# Altium project StarWars.PrjPcb
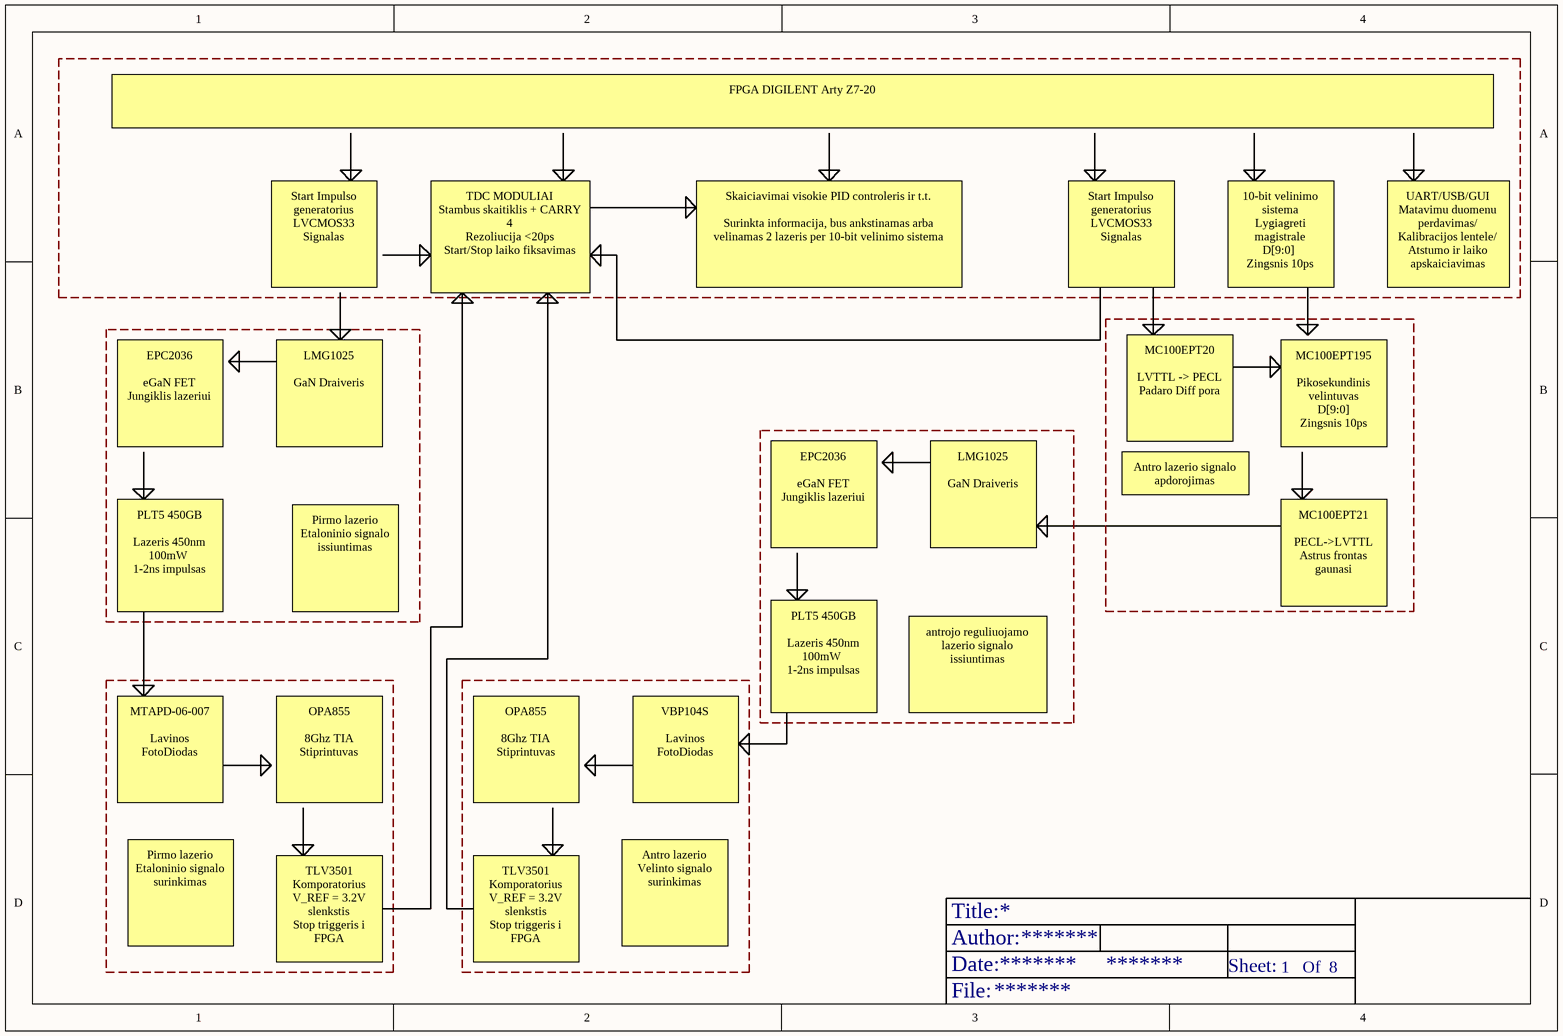
[diagram p0: Blokine diagrama.SchDoc]
8 sheets, 146 parts. Net scope: flat (ports and power ports of the same name join across sheets).
Board file: Prototype_REV1.PcbDoc
Sheets:
  Blokine diagrama.SchDoc
  Inputs_Outputs.SchDoc
  Rx_PSU.SchDoc
  Tx_PSU.SchDoc
  Time_Delay.SchDoc
  Laser_Driver.SchDoc
  Light_Detection.SchDoc
  Laser_System.SchDoc

## Sheet Blokine diagrama.SchDoc
size A4; Date: *******; ApprovedBy: *******; CheckedBy: None; Author: *******; CompanyName: *******; DrawnBy: Name; Engineer: *******; Organization: *******; Address1: *******; Address2: *******; Address3: *******; Address4: *******; DocumentNumber: Doc Num; Revision: *******; SheetNumber: 1; SheetTotal: 8; CurrentTime: *******; CurrentDate: *******; Time: *******; DocumentFullPathAndName: *******; DocumentName: *******; ModifiedDate: *******; ImagePath: *******; ProjectName: *******; Application_BuildNumber: *******

### Notes on the sheet
- FPGA DIGILENT Arty Z7-20
- Start Impulso generatorius
  LVCMOS33 Signalas
- TDC MODULIAI
  Stambus skaitiklis + CARRY 4
  Rezoliucija <20ps
  Start/Stop laiko fiksavimas
- Skaiciavimai visokie PID controleris ir t.t.
  Surinkta informacija, bus ankstinamas arba velinamas 2 lazeris per 10-bit velinimo sistema
- 10-bit velinimo sistema
  Lygiagreti magistrale
  D[9:0]
  Zingsnis 10ps
- UART/USB/GUI
  Matavimu duomenu perdavimas/
  Kalibracijos lentele/
  Atstumo ir laiko apskaiciavimas
- EPC2036
  eGaN FET
  Jungiklis lazeriui
- LMG1025
  GaN Draiveris
- MC100EPT20
  LVTTL -> PECL
  Padaro Diff pora
- MC100EPT195
  Pikosekundinis velintuvas
  D[9:0]
  Zingsnis 10ps
- Antro lazerio signalo apdorojimas
- PLT5 450GB
  Lazeris 450nm
  100mW
  1-2ns impulsas
- Pirmo lazerio
  Etaloninio signalo issiuntimas
- MC100EPT21
  PECL->LVTTL
  Astrus frontas gaunasi
- antrojo reguliuojamo lazerio signalo issiuntimas
- MTAPD-06-007
  Lavinos FotoDiodas
- OPA855
  8Ghz TIA Stiprintuvas
- VBP104S
  Lavinos FotoDiodas
- Pirmo lazerio
  Etaloninio signalo surinkimas
- TLV3501
  Komporatorius
  V_REF = 3.2V slenkstis
  Stop triggeris i FPGA
- Antro lazerio
  Velinto signalo surinkimas
- Title:
- Date:
- Author:
- Sheet:
- Of
- File:

## Sheet Inputs_Outputs.SchDoc
size A4; Date: *******; ApprovedBy: *******; CheckedBy: None; Author: *******; CompanyName: *******; DrawnBy: Name; Engineer: *******; Organization: *******; Address1: *******; Address2: *******; Address3: *******; Address4: *******; DocumentNumber: Doc Num; Revision: *******; SheetNumber: 2; SheetTotal: 8; CurrentTime: *******; CurrentDate: *******; Time: *******; DocumentFullPathAndName: *******; DocumentName: *******; ModifiedDate: *******; ImagePath: *******; ProjectName: *******; Application_BuildNumber: *******
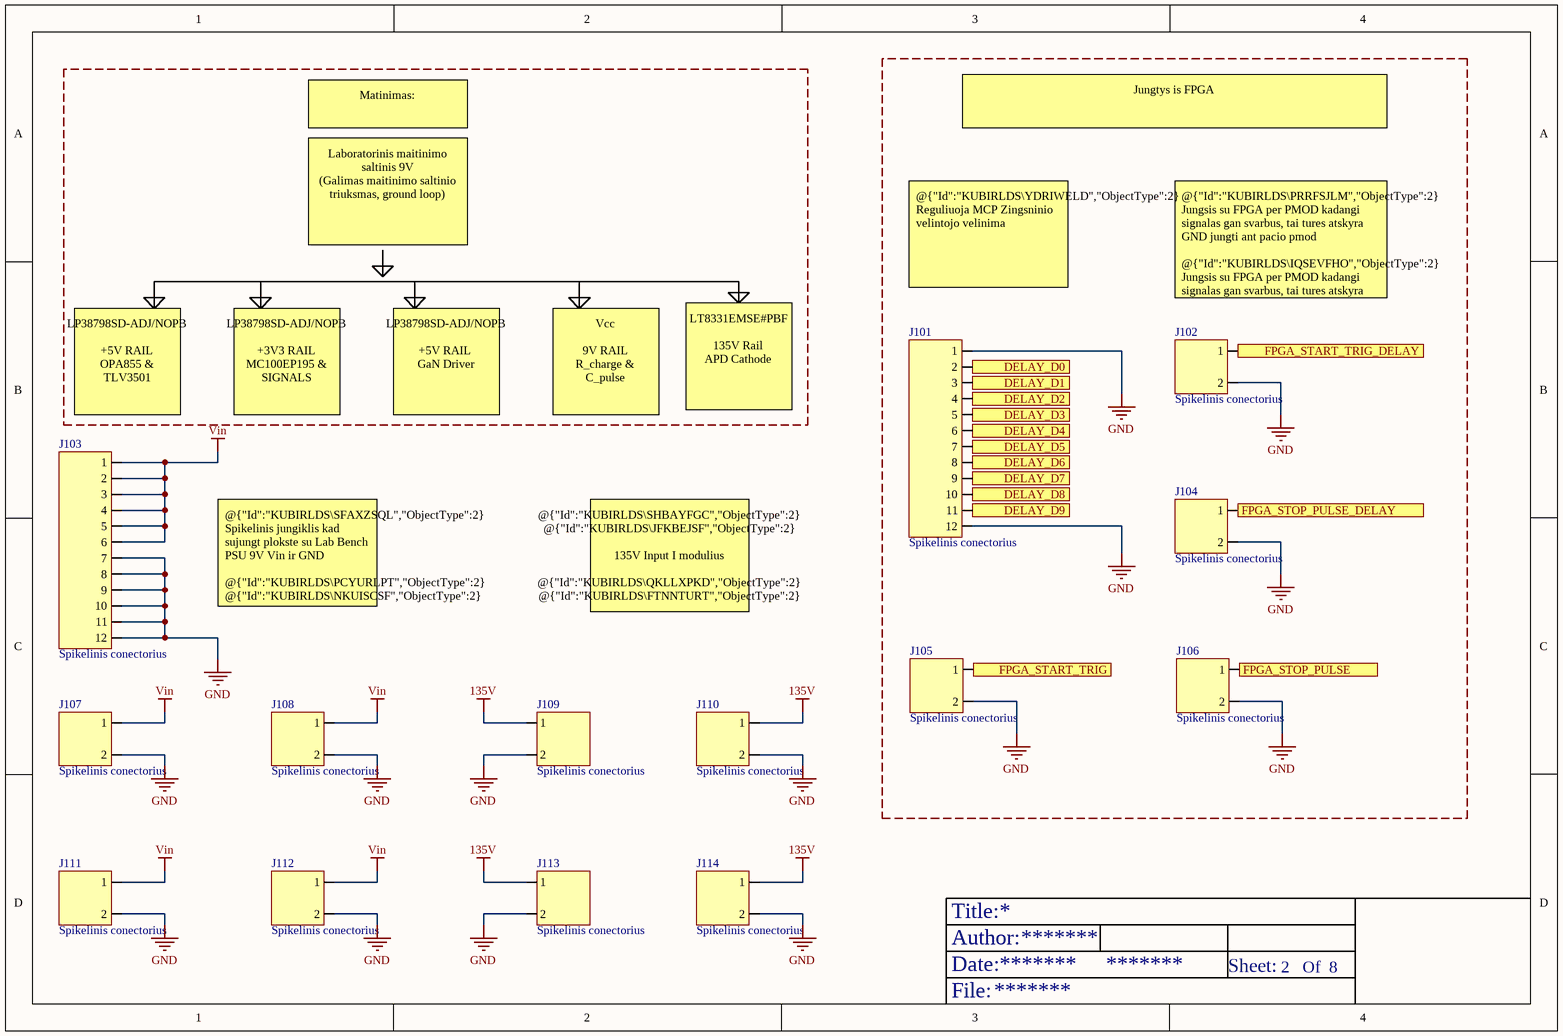
[diagram p1: Inputs_Outputs.SchDoc]

### Parts
J101  Spikelinis conectorius  [12pin header strip]
J102  Spikelinis conectorius  [2Pin header strip]
J103  Spikelinis conectorius  [12pin header strip]
J104  Spikelinis conectorius  [2Pin header strip]
J105  Spikelinis conectorius  [2Pin header strip]
J106  Spikelinis conectorius  [2Pin header strip]
J107  Spikelinis conectorius  [2Pin header strip]
J108  Spikelinis conectorius  [2Pin header strip]
J109  Spikelinis conectorius  [2Pin header strip]
J110  Spikelinis conectorius  [2Pin header strip]
J111  Spikelinis conectorius  [2Pin header strip]
J112  Spikelinis conectorius  [2Pin header strip]
J113  Spikelinis conectorius  [2Pin header strip]
J114  Spikelinis conectorius  [2Pin header strip]

### Ports
DELAY_D0 (see Time_Delay[2B]), DELAY_D1 (see Time_Delay[2B]), DELAY_D2 (see Time_Delay[2B]), DELAY_D3 (see Time_Delay[2C]), DELAY_D4 (see Time_Delay[2C]), DELAY_D5 (see Time_Delay[2C]), DELAY_D6 (see Time_Delay[2C]), DELAY_D7 (see Time_Delay[2C]), DELAY_D8 (see Time_Delay[2C]), DELAY_D9 (see Time_Delay[2C]), FPGA_START_TRIG (see Laser_Driver[1C]), FPGA_START_TRIG_DELAY (see Time_Delay[1B]), FPGA_STOP_PULSE (see Light_Detection[4C]), FPGA_STOP_PULSE_DELAY (see Light_Detection[4B])

### Nets
135V: J109.1 J110.1 J113.1 J114.1
GND: J101.1 J101.12 J102.2 J103.7 J103.8 J103.9 J103.10 J103.11 J103.12 J104.2 J105.2 J106.2 J107.2 J108.2 J109.2 J110.2 J111.2 J112.2 J113.2 J114.2
Vin: J103.1 J103.2 J103.3 J103.4 J103.5 J103.6 J107.1 J108.1 J111.1 J112.1
NetJ101_2: J101.2 ; port DELAY_D0
NetJ101_3: J101.3 ; port DELAY_D1
NetJ101_4: J101.4 ; port DELAY_D2
NetJ101_5: J101.5 ; port DELAY_D3
NetJ101_6: J101.6 ; port DELAY_D4
NetJ101_7: J101.7 ; port DELAY_D5
NetJ101_8: J101.8 ; port DELAY_D6
NetJ101_9: J101.9 ; port DELAY_D7
NetJ101_10: J101.10 ; port DELAY_D8
NetJ101_11: J101.11 ; port DELAY_D9
NetJ102_1: J102.1 ; port FPGA_START_TRIG_DELAY
NetJ104_1: J104.1 ; port FPGA_STOP_PULSE_DELAY
NetJ105_1: J105.1 ; port FPGA_START_TRIG
NetJ106_1: J106.1 ; port FPGA_STOP_PULSE

### Notes on the sheet
- Matinimas:
- Jungtys is FPGA
- Laboratorinis maitinimo saltinis 9V
  (Galimas maitinimo saltinio triuksmas, ground loop)
- @{"Id":"KUBIRLDS\YDRIWELD","ObjectType":2} Reguliuoja MCP Zingsninio velintojo velinima
- (near J102) @{"Id":"KUBIRLDS\PRRFSJLM","ObjectType":2} Jungsis su FPGA per PMOD kadangi signalas gan svarbus, tai tures atskyra GND jungti ant pacio pmod
  @{"Id":"KUBIRLDS\IQSEVFHO","ObjectType":2} Jungsis su FPGA per PMOD kadangi signalas gan svarbus, tai tures atskyra GND jungti ant pacio pmod
- (near J103) LP38798SD-ADJ/NOPB
  +5V RAIL OPA855 & TLV3501
- LP38798SD-ADJ/NOPB
  +3V3 RAIL MC100EP195 & SIGNALS
- LP38798SD-ADJ/NOPB
  +5V RAIL
  GaN Driver
- Vcc
  9V RAIL
  R_charge & C_pulse
- LT8331EMSE#PBF
  135V Rail
  APD Cathode
- @{"Id":"KUBIRLDS\SFAXZSQL","ObjectType":2} Spikelinis jungiklis kad sujungt plokste su Lab Bench PSU 9V Vin ir GND
  @{"Id":"KUBIRLDS\PCYURLPT","ObjectType":2} @{"Id":"KUBIRLDS\NKUISCSF","ObjectType":2} @{"Id":"KUBIRLDS\BNXFPSCR","ObjectType":2} @{"Id":"KUBIRLDS\LABZKUAZ","ObjectType":2} Vin Maitinimai i modulius
- @{"Id":"KUBIRLDS\SHBAYFGC","ObjectType":2} @{"Id":"KUBIRLDS\JFKBEJSF","ObjectType":2}
  135V Input I modulius
  @{"Id":"KUBIRLDS\QKLLXPKD","ObjectType":2} @{"Id":"KUBIRLDS\FTNNTURT","ObjectType":2}
  135V Output I Modulius
- Title:
- Date:
- Author:
- Sheet:
- Of
- File:

### Library data of the parts
J101 J103 = 12PinConnector: TSW-112-07-G-S
J102 J104-J114 = 2PinConnector

## Sheet Rx_PSU.SchDoc
size A4; Date: *******; ApprovedBy: *******; CheckedBy: None; Author: *******; CompanyName: *******; DrawnBy: Name; Engineer: *******; Organization: *******; Address1: *******; Address2: *******; Address3: *******; Address4: *******; DocumentNumber: Doc Num; Revision: *******; SheetNumber: 3; SheetTotal: 8; CurrentTime: *******; CurrentDate: *******; Time: *******; DocumentFullPathAndName: *******; DocumentName: *******; ModifiedDate: *******; ImagePath: *******; ProjectName: *******; Application_BuildNumber: *******
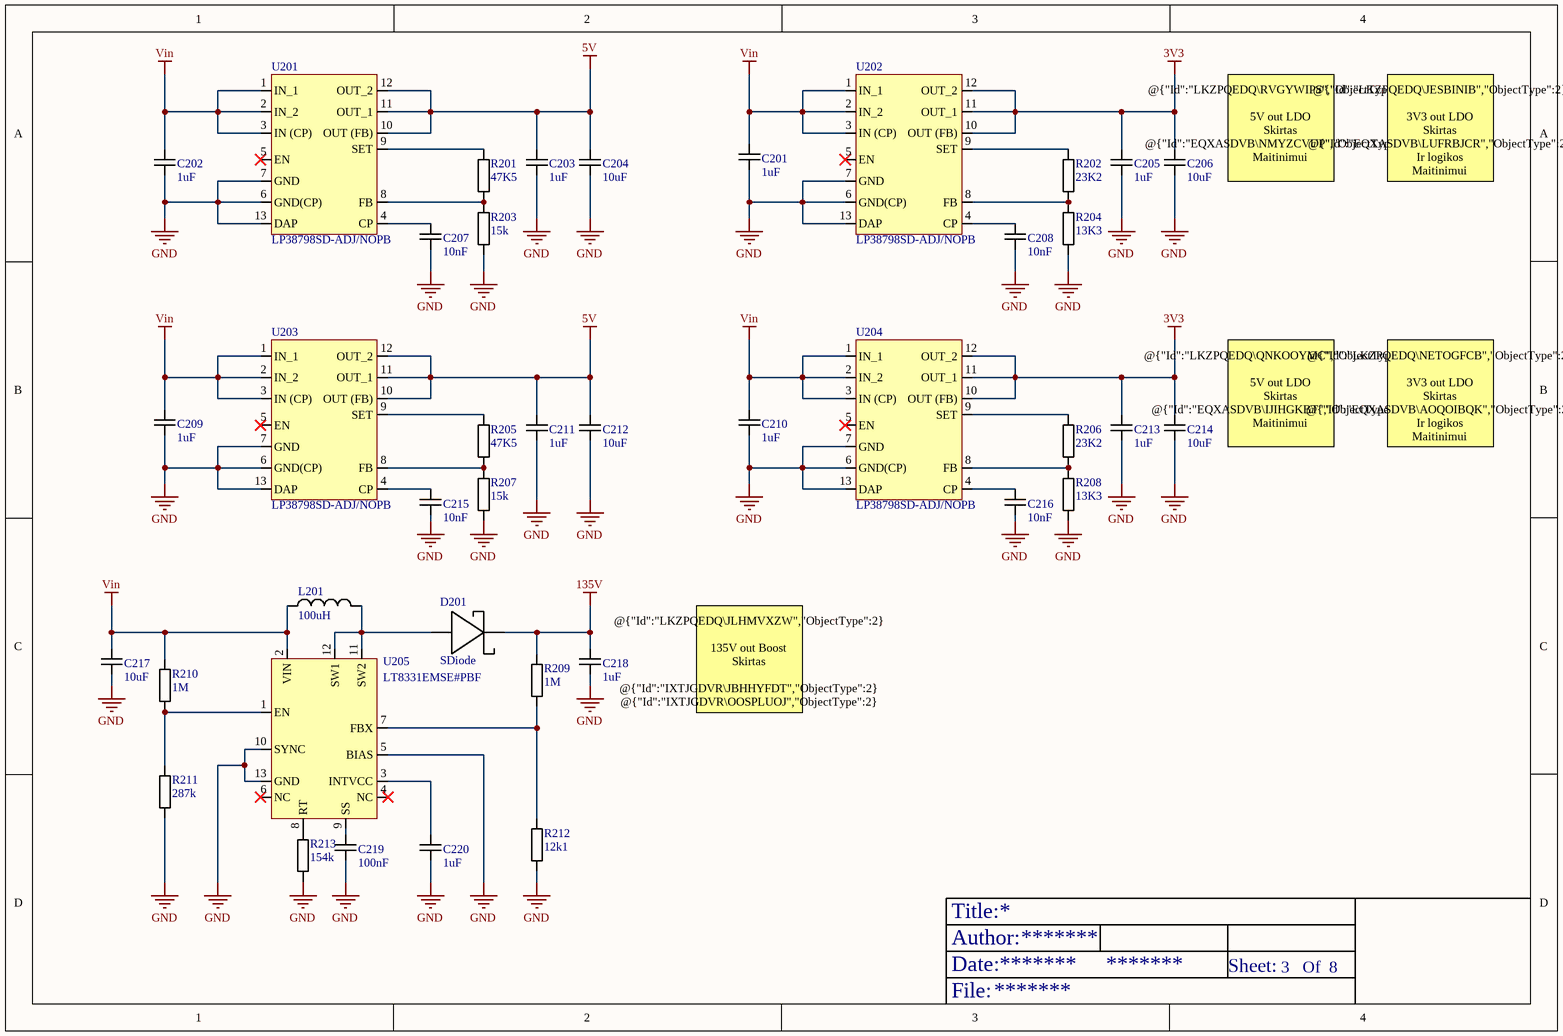
[diagram p2: Rx_PSU.SchDoc]

### Parts
C201  1uF  [1uF 0603]
C202  1uF  [1uF 0603]
C203  1uF  [1uF 0603]
C204  10uF  [10uF 0805]
C205  1uF  [1uF 0603]
C206  10uF  [10uF 0805]
C207  10nF  [10nF 0402]
C208  10nF  [10nF 0402]
C209  1uF  [1uF 0603]
C210  1uF  [1uF 0603]
C211  1uF  [1uF 0603]
C212  10uF  [10uF 0805]
C213  1uF  [1uF 0603]
C214  10uF  [10uF 0805]
C215  10nF  [10nF 0402]
C216  10nF  [10nF 0402]
C217  10uF  [10uF 0805]
C218  1uF  [1uF 2220]
C219  100nF  [100nF 0402]
C220  1uF  [1uF 0603]
D201  SDiode  [SDiode]
L201  100uH  [100uH]
R201  47K5  [47.5k 0402]
R202  23K2  [23.2k 0402]
R203  15k  [15k 0402]
R204  13K3  [13k3 0402]
R205  47K5  [47.5k 0402]
R206  23K2  [23.2k 0402]
R207  15k  [15k 0402]
R208  13K3  [13k3 0402]
R209  1M  [1M 0402]
R210  1M  [1M 0402]
R211  287k  [1M 0402]
R212  12k1  [1M 0402]
R213  154k  [1M 0402]
U201  LP38798SD-ADJ/NOPB  [LP38798SD-ADJ/NOPB]
U202  LP38798SD-ADJ/NOPB  [LP38798SD-ADJ/NOPB]
U203  LP38798SD-ADJ/NOPB  [LP38798SD-ADJ/NOPB]
U204  LP38798SD-ADJ/NOPB  [LP38798SD-ADJ/NOPB]
U205  LT8331EMSE#PBF  [LT8331EMSE#PBF]

### Nets
3V3: C205.2 C206.2 C213.2 C214.2 U202.10(OUT_(FB)) U202.11(OUT_1) U202.12(OUT_2) U204.10(OUT_(FB)) U204.11(OUT_1) U204.12(OUT_2)
5V: C203.2 C204.2 C211.2 C212.2 U201.10(OUT_(FB)) U201.11(OUT_1) U201.12(OUT_2) U203.10(OUT_(FB)) U203.11(OUT_1) U203.12(OUT_2)
135V: C218.2 D201.1 R209.2
GND: C201.1 C202.1 C203.1 C204.1 C205.1 C206.1 C207.1 C208.1 C209.1 C210.1 C211.1 C212.1 C213.1 C214.1 C215.1 C216.1 C217.1 C218.1 C219.1 C220.1 R203.1 R204.1 R207.1 R208.1 R211.1 R212.1 R213.1 U201.6(GND(CP)) U201.7(GND) U201.13(DAP) U202.6(GND(CP)) U202.7(GND) U202.13(DAP) U203.6(GND(CP)) U203.7(GND) U203.13(DAP) U204.6(GND(CP)) U204.7(GND) U204.13(DAP) U205.5(BIAS) U205.10(SYNC) U205.13(GND)
Vin: C201.2 C202.2 C209.2 C210.2 C217.2 L201.1 R210.2 U201.1(IN_1) U201.2(IN_2) U201.3(IN_(CP)) U202.1(IN_1) U202.2(IN_2) U202.3(IN_(CP)) U203.1(IN_1) U203.2(IN_2) U203.3(IN_(CP)) U204.1(IN_1) U204.2(IN_2) U204.3(IN_(CP)) U205.2(VIN)
NetC207_2: C207.2 U201.4(CP)
NetC208_2: C208.2 U202.4(CP)
NetC215_2: C215.2 U203.4(CP)
NetC216_2: C216.2 U204.4(CP)
NetC219_2: C219.2 U205.9(SS)
NetC220_2: C220.2 U205.3(INTVCC)
NetD201_2: D201.2 L201.2 U205.11(SW2) U205.12(SW1)
NetR201_1: R201.1 R203.2 U201.8(FB)
NetR201_2: R201.2 U201.9(SET)
NetR202_1: R202.1 U202.9(SET)
NetR202_2: R202.2 R204.2 U202.8(FB)
NetR205_1: R205.1 R207.2 U203.8(FB)
NetR205_2: R205.2 U203.9(SET)
NetR206_1: R206.1 U204.9(SET)
NetR206_2: R206.2 R208.2 U204.8(FB)
NetR209_1: R209.1 R212.2 U205.7(FBX)
NetR210_1: R210.1 R211.2 U205.1(EN)
NetR213_2: R213.2 U205.8(RT)

Not connected (* = marked no-connect by the designer): U201 5(EN)*; U202 5(EN)*; U203 5(EN)*; U204 5(EN)*; U205 4(NC)* 6(NC)*

### Notes on the sheet
- (near C206) @{"Id":"LKZPQEDQ\RVGYWIPS","ObjectType":2}
  5V out LDO
  Skirtas @{"Id":"EQXASDVB\NMYZCVUP","ObjectType":2}
  Maitinimui
- @{"Id":"LKZPQEDQ\JESBINIB","ObjectType":2}
  3V3 out LDO
  Skirtas @{"Id":"EQXASDVB\LUFRBJCR","ObjectType":2}
  Ir logikos
  Maitinimui
- (near C214) @{"Id":"LKZPQEDQ\QNKOOYMC","ObjectType":2}
  5V out LDO
  Skirtas @{"Id":"EQXASDVB\IJIHGKBT","ObjectType":2}
  Maitinimui
- @{"Id":"LKZPQEDQ\NETOGFCB","ObjectType":2}
  3V3 out LDO
  Skirtas @{"Id":"EQXASDVB\AOQOIBQK","ObjectType":2}
  Ir logikos
  Maitinimui
- @{"Id":"LKZPQEDQ\JLHMVXZW","ObjectType":2}
  135V out Boost
  Skirtas
  @{"Id":"IXTJGDVR\JBHHYFDT","ObjectType":2} @{"Id":"IXTJGDVR\OOSPLUOJ","ObjectType":2}
  Maitinimui
- Title:
- Date:
- Author:
- Sheet:
- Of
- File:

### Library data of the parts
C201-C203 C205 C209-C211 C213 C220 = 1uF 0603: CGA3E1X7R1E105K080AC
C204 C206 C212 C214 C217 = 10uF 0805: GRJ21BR61E106KE01K
C207 C208 C215 C216 = 10nF 0402: C0402C103J5RACTU
C218 = 1uF 2220
C219 = 100n 0402: C1005X7R1E104K050BB
D201 = 755-RB558VAM150TR
L201 = 100uH: 744066101
R201 R205 = 47K5 0402: CR0402-FX-4752GLF
R202 R206 = 23K2 0402: CR0402-FX-2322GLF
R203 R207 = 15k 0402: CRCW040215K0FKED
R204 R208 = 13K3 0402: CRCW040213K3FKED
R209 R210 = 1M 0402: RC0402FR-7D1ML
R211 = 287k 0402: RC0402FR-07287KL
R212 = 12k1 0402: RC0402FR-0712K1L
R213 = 154k 0402: RE0402BRE07154KL
U201-U204 = LP38798SD-ADJ/NOPB: input 3-20V output 1.5-5V

## Sheet Tx_PSU.SchDoc
size A4; Date: *******; ApprovedBy: *******; CheckedBy: None; Author: *******; CompanyName: *******; DrawnBy: Name; Engineer: *******; Organization: *******; Address1: *******; Address2: *******; Address3: *******; Address4: *******; DocumentNumber: Doc Num; Revision: *******; SheetNumber: 4; SheetTotal: 8; CurrentTime: *******; CurrentDate: *******; Time: *******; DocumentFullPathAndName: *******; DocumentName: *******; ModifiedDate: *******; ImagePath: *******; ProjectName: *******; Application_BuildNumber: *******
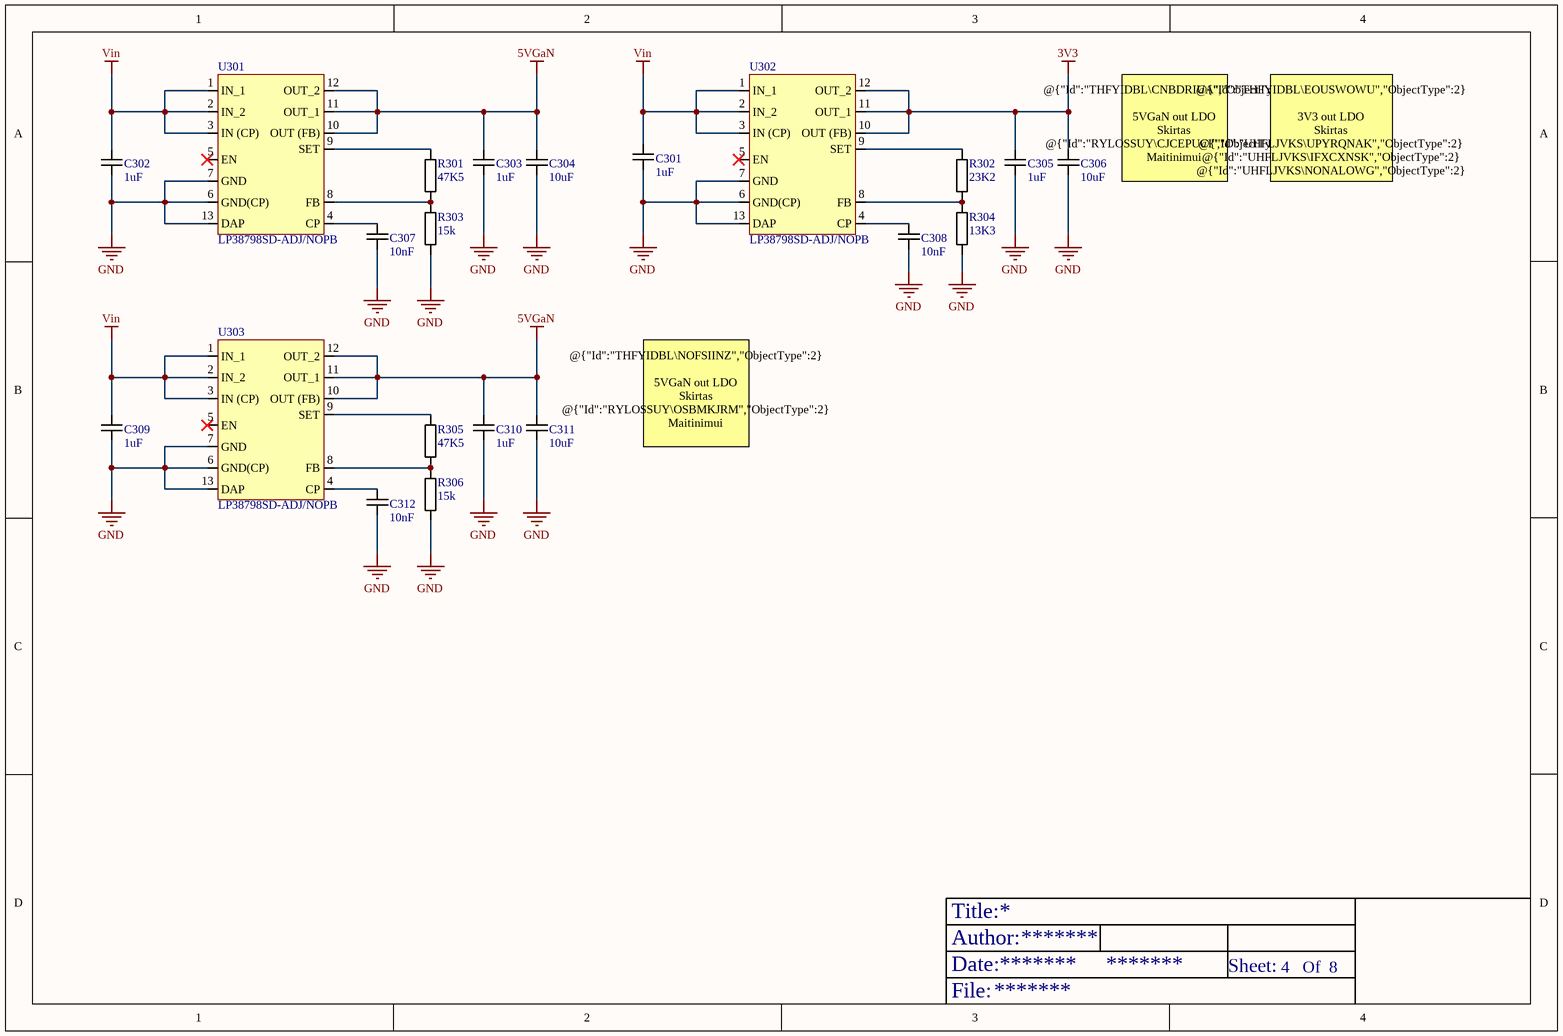
[diagram p3: Tx_PSU.SchDoc]

### Parts
C301  1uF  [1uF 0603]
C302  1uF  [1uF 0603]
C303  1uF  [1uF 0603]
C304  10uF  [10uF 0805]
C305  1uF  [1uF 0603]
C306  10uF  [10uF 0805]
C307  10nF  [10nF 0402]
C308  10nF  [10nF 0402]
C309  1uF  [1uF 0603]
C310  1uF  [1uF 0603]
C311  10uF  [10uF 0805]
C312  10nF  [10nF 0402]
R301  47K5  [47.5k 0402]
R302  23K2  [23.2k 0402]
R303  15k  [15k 0402]
R304  13K3  [13k3 0402]
R305  47K5  [47.5k 0402]
R306  15k  [15k 0402]
U301  LP38798SD-ADJ/NOPB  [LP38798SD-ADJ/NOPB]
U302  LP38798SD-ADJ/NOPB  [LP38798SD-ADJ/NOPB]
U303  LP38798SD-ADJ/NOPB  [LP38798SD-ADJ/NOPB]

### Nets
3V3: C305.2 C306.2 U302.10(OUT_(FB)) U302.11(OUT_1) U302.12(OUT_2)
5VGaN: C303.2 C304.2 C310.2 C311.2 U301.10(OUT_(FB)) U301.11(OUT_1) U301.12(OUT_2) U303.10(OUT_(FB)) U303.11(OUT_1) U303.12(OUT_2)
GND: C301.1 C302.1 C303.1 C304.1 C305.1 C306.1 C307.1 C308.1 C309.1 C310.1 C311.1 C312.1 R303.1 R304.1 R306.1 U301.6(GND(CP)) U301.7(GND) U301.13(DAP) U302.6(GND(CP)) U302.7(GND) U302.13(DAP) U303.6(GND(CP)) U303.7(GND) U303.13(DAP)
Vin: C301.2 C302.2 C309.2 U301.1(IN_1) U301.2(IN_2) U301.3(IN_(CP)) U302.1(IN_1) U302.2(IN_2) U302.3(IN_(CP)) U303.1(IN_1) U303.2(IN_2) U303.3(IN_(CP))
NetC307_2: C307.2 U301.4(CP)
NetC308_2: C308.2 U302.4(CP)
NetC312_2: C312.2 U303.4(CP)
NetR301_1: R301.1 R303.2 U301.8(FB)
NetR301_2: R301.2 U301.9(SET)
NetR302_1: R302.1 U302.9(SET)
NetR302_2: R302.2 R304.2 U302.8(FB)
NetR305_1: R305.1 R306.2 U303.8(FB)
NetR305_2: R305.2 U303.9(SET)

Not connected (* = marked no-connect by the designer): U301 5(EN)*; U302 5(EN)*; U303 5(EN)*

### Notes on the sheet
- (near C306) @{"Id":"THFYIDBL\CNBDRIUA","ObjectType":2}
  5VGaN out LDO
  Skirtas @{"Id":"RYLOSSUY\CJCEPUCI","ObjectType":2}
  Maitinimui
- @{"Id":"THFYIDBL\EOUSWOWU","ObjectType":2}
  3V3 out LDO
  Skirtas
  @{"Id":"UHFLJVKS\UPYRQNAK","ObjectType":2} @{"Id":"UHFLJVKS\IFXCXNSK","ObjectType":2} @{"Id":"UHFLJVKS\NONALOWG","ObjectType":2}
  Maitinimui
- @{"Id":"THFYIDBL\NOFSIINZ","ObjectType":2}
  5VGaN out LDO
  Skirtas @{"Id":"RYLOSSUY\OSBMKJRM","ObjectType":2}
  Maitinimui
- Title:
- Date:
- Author:
- Sheet:
- Of
- File:

### Library data of the parts
C301-C303 C305 C309 C310 = 1uF 0603: CGA3E1X7R1E105K080AC
C304 C306 C311 = 10uF 0805: GRJ21BR61E106KE01K
C307 C308 C312 = 10nF 0402: C0402C103J5RACTU
R301 R305 = 47K5 0402: CR0402-FX-4752GLF
R302 = 23K2 0402: CR0402-FX-2322GLF
R303 R306 = 15k 0402: CRCW040215K0FKED
R304 = 13K3 0402: CRCW040213K3FKED
U301-U303 = LP38798SD-ADJ/NOPB: input 3-20V output 1.5-5V

## Sheet Time_Delay.SchDoc
size A4; Date: *******; ApprovedBy: *******; CheckedBy: None; Author: *******; CompanyName: *******; DrawnBy: Name; Engineer: *******; Organization: *******; Address1: *******; Address2: *******; Address3: *******; Address4: *******; DocumentNumber: Doc Num; Revision: *******; SheetNumber: 5; SheetTotal: 8; CurrentTime: *******; CurrentDate: *******; Time: *******; DocumentFullPathAndName: *******; DocumentName: *******; ModifiedDate: *******; ImagePath: *******; ProjectName: *******; Application_BuildNumber: *******
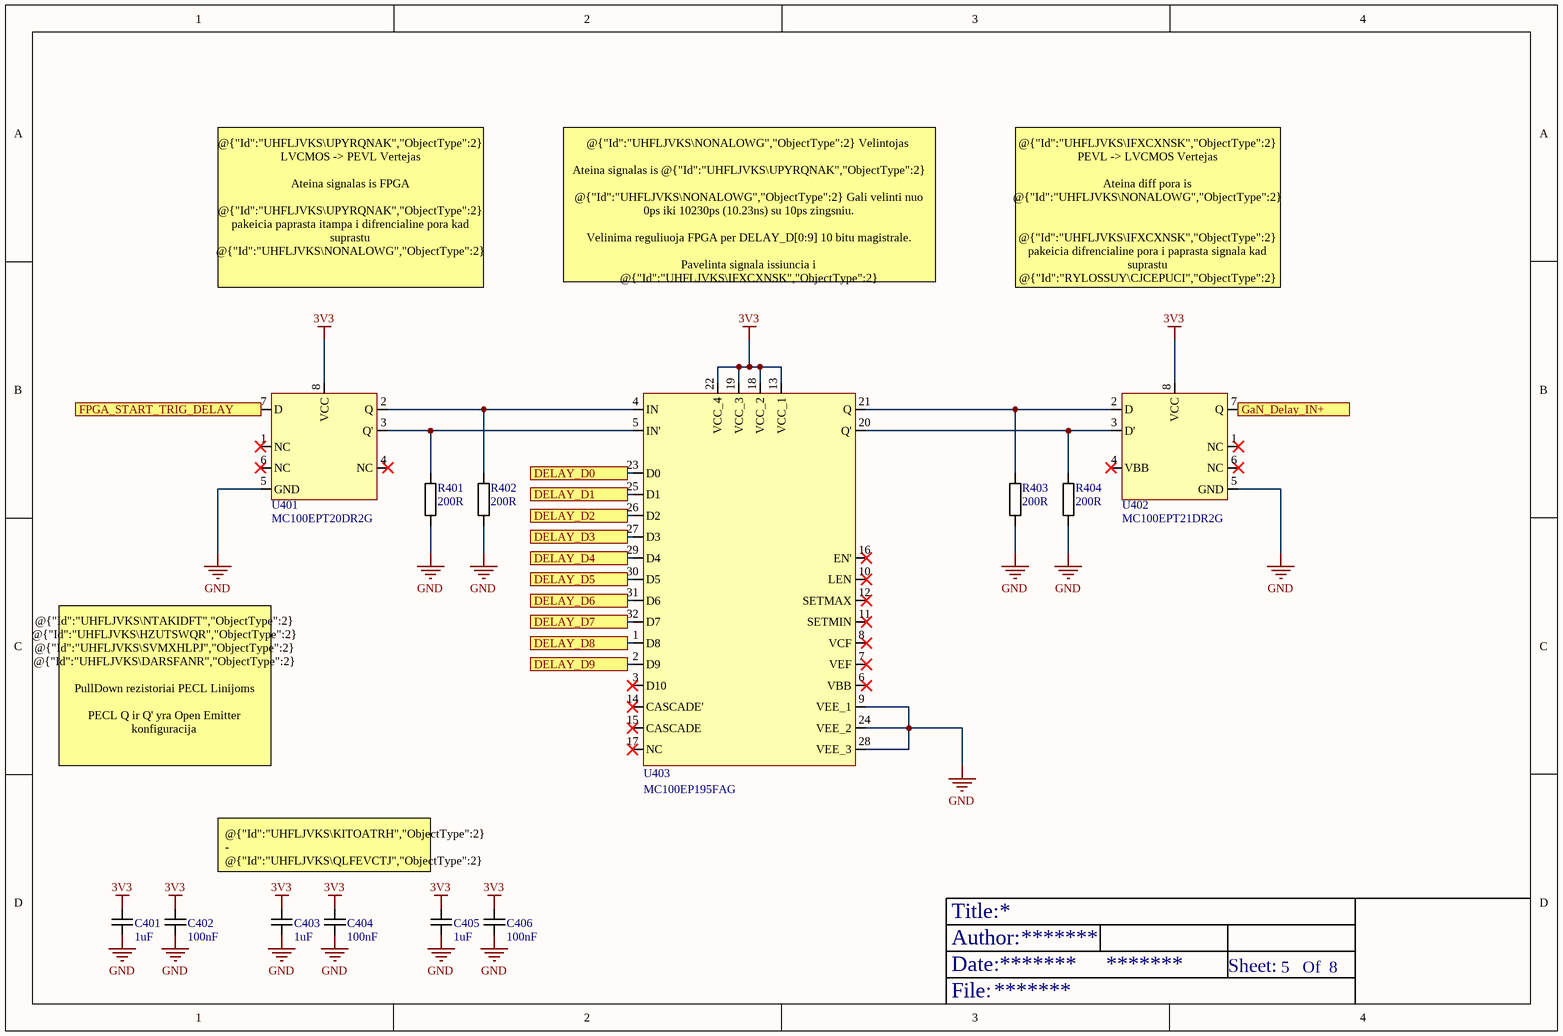
[diagram p4: Time_Delay.SchDoc]

### Parts
C401  1uF  [1uF 0603]
C402  100nF  [100nF 0402]
C403  1uF  [1uF 0603]
C404  100nF  [100nF 0402]
C405  1uF  [1uF 0603]
C406  100nF  [100nF 0402]
R401  200R  [200R 0402]
R402  200R  [200R 0402]
R403  200R  [200R 0402]
R404  200R  [200R 0402]
U401  MC100EPT20DR2G  [MC100EPT20DR2G]
U402  MC100EPT21DR2G  [MC100EPT21DR2G]
U403  MC100EP195FAG  [MC100EP195FAG]

### Ports
DELAY_D0 (see Inputs_Outputs[3B]), DELAY_D1 (see Inputs_Outputs[3B]), DELAY_D2 (see Inputs_Outputs[3B]), DELAY_D3 (see Inputs_Outputs[3B]), DELAY_D4 (see Inputs_Outputs[3B]), DELAY_D5 (see Inputs_Outputs[3B]), DELAY_D6 (see Inputs_Outputs[3B]), DELAY_D7 (see Inputs_Outputs[3B]), DELAY_D8 (see Inputs_Outputs[3B]), DELAY_D9 (see Inputs_Outputs[3B]), FPGA_START_TRIG_DELAY (see Inputs_Outputs[4B]), GaN_Delay_IN+ (see Laser_Driver[1B])

### Nets
3V3: C401.2 C402.2 C403.2 C404.2 C405.2 C406.2 U401.8(VCC) U402.8(VCC) U403.13(VCC_1) U403.18(VCC_2) U403.19(VCC_3) U403.22(VCC_4)
GND: C401.1 C402.1 C403.1 C404.1 C405.1 C406.1 R401.1 R402.1 R403.1 R404.1 U401.5(GND) U402.5(GND) U403.9(VEE_1) U403.24(VEE_2) U403.28(VEE_3)
NetJ101_2: U403.23(D0) ; port DELAY_D0
NetJ101_3: U403.25(D1) ; port DELAY_D1
NetJ101_4: U403.26(D2) ; port DELAY_D2
NetJ101_5: U403.27(D3) ; port DELAY_D3
NetJ101_6: U403.29(D4) ; port DELAY_D4
NetJ101_7: U403.30(D5) ; port DELAY_D5
NetJ101_8: U403.31(D6) ; port DELAY_D6
NetJ101_9: U403.32(D7) ; port DELAY_D7
NetJ101_10: U403.1(D8) ; port DELAY_D8
NetJ101_11: U403.2(D9) ; port DELAY_D9
NetJ102_1: U401.7(D) ; port FPGA_START_TRIG_DELAY
NetR401_2: R401.2 U401.3(Q') U403.5(IN')
NetR402_2: R402.2 U401.2(Q) U403.4(IN)
NetR403_2: R403.2 U402.2(D) U403.21(Q)
NetR404_2: R404.2 U402.3(D') U403.20(Q')
NetR502_2: U402.7(Q) ; port GaN_Delay_IN+

Not connected (* = marked no-connect by the designer): U401 1(NC)* 4(NC)* 6(NC)*; U402 1(NC)* 4(VBB)* 6(NC)*; U403 3(D10)* 6(VBB)* 7(VEF)* 8(VCF)* 10(LEN)* 11(SETMIN)* 12(SETMAX)* 14(CASCADE')* 15(CASCADE)* 16(EN')* 17(NC)*

### Notes on the sheet
- @{"Id":"UHFLJVKS\UPYRQNAK","ObjectType":2} LVCMOS -> PEVL Vertejas
  Ateina signalas is FPGA
  @{"Id":"UHFLJVKS\UPYRQNAK","ObjectType":2} pakeicia paprasta itampa i difrencialine pora kad suprastu @{"Id":"UHFLJVKS\NONALOWG","ObjectType":2}
- @{"Id":"UHFLJVKS\NONALOWG","ObjectType":2} Velintojas
  Ateina signalas is @{"Id":"UHFLJVKS\UPYRQNAK","ObjectType":2}
  @{"Id":"UHFLJVKS\NONALOWG","ObjectType":2} Gali velinti nuo 0ps iki 10230ps (10.23ns) su 10ps zingsniu.
  Velinima reguliuoja FPGA per DELAY_D[0:9] 10 bitu magistrale.
  Pavelinta signala issiuncia i @{"Id":"UHFLJVKS\IFXCXNSK","ObjectType":2}
- @{"Id":"UHFLJVKS\IFXCXNSK","ObjectType":2} PEVL -> LVCMOS Vertejas
  Ateina diff pora is @{"Id":"UHFLJVKS\NONALOWG","ObjectType":2}
  @{"Id":"UHFLJVKS\IFXCXNSK","ObjectType":2} pakeicia difrencialine pora i paprasta signala kad suprastu @{"Id":"RYLOSSUY\CJCEPUCI","ObjectType":2}
- @{"Id":"UHFLJVKS\NTAKIDFT","ObjectType":2} @{"Id":"UHFLJVKS\HZUTSWQR","ObjectType":2} @{"Id":"UHFLJVKS\SVMXHLPJ","ObjectType":2} @{"Id":"UHFLJVKS\DARSFANR","ObjectType":2}
  PullDown rezistoriai PECL Linijoms
  PECL Q ir Q' yra Open Emitter konfiguracija
- @{"Id":"UHFLJVKS\KITOATRH","ObjectType":2} - @{"Id":"UHFLJVKS\QLFEVCTJ","ObjectType":2}
  Bus prie @{"Id":"UHFLJVKS\UPYRQNAK","ObjectType":2} - @{"Id":"UHFLJVKS\NONALOWG","ObjectType":2} Iejimu
- Title:
- Date:
- Author:
- Sheet:
- Of
- File:

### Library data of the parts
C401 C403 C405 = 1uF 0603: CGA3E1X7R1E105K080AC
C402 C404 C406 = 100n 0402: C1005X7R1E104K050BB
R401-R404 = 200R 0402: ERA-2AED201X

## Sheet Laser_Driver.SchDoc
size A4; Date: *******; ApprovedBy: *******; CheckedBy: None; Author: *******; CompanyName: *******; DrawnBy: Name; Engineer: *******; Organization: *******; Address1: *******; Address2: *******; Address3: *******; Address4: *******; DocumentNumber: Doc Num; Revision: *******; SheetNumber: 6; SheetTotal: 8; CurrentTime: *******; CurrentDate: *******; Time: *******; DocumentFullPathAndName: *******; DocumentName: *******; ModifiedDate: *******; ImagePath: *******; ProjectName: *******; Application_BuildNumber: *******
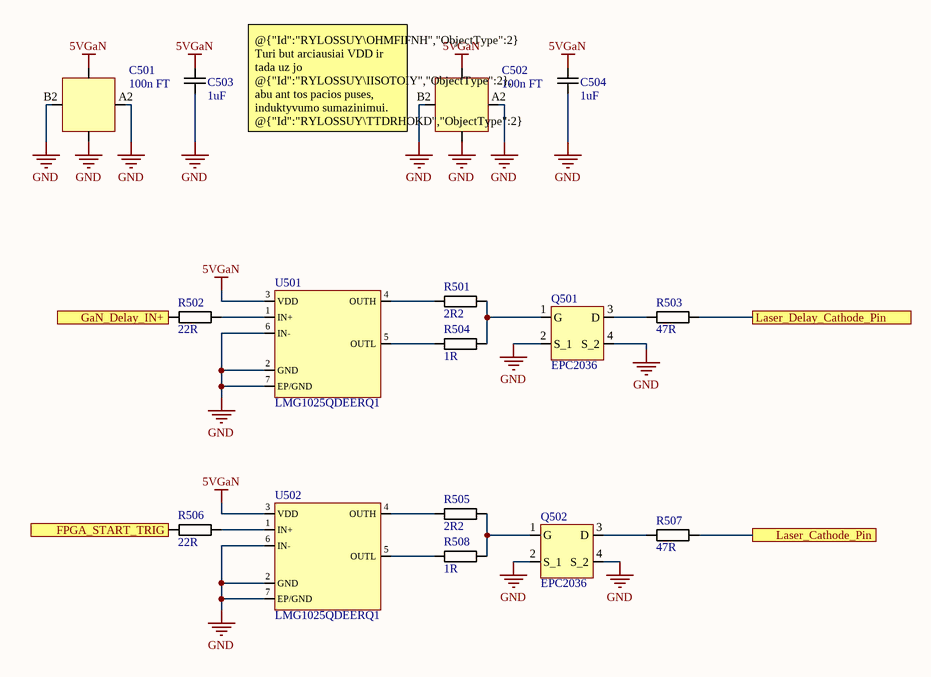
[diagram p5: Laser_Driver.SchDoc]

### Parts
C501  100n FT  [100n FT 0603]
C502  100n FT  [100n FT 0603]
C503  1uF  [1uF 0603]
C504  1uF  [1uF 0603]
Q501  EPC2036  [EPC2036]
Q502  EPC2036  [EPC2036]
R501  2R2  [2R2 0402]
R502  22R  [22R 0402]
R503  47R  [1R 0402]
R504  1R  [1R 0402]
R505  2R2  [2R2 0402]
R506  22R  [22R 0402]
R507  47R  [1R 0402]
R508  1R  [1R 0402]
U501  LMG1025QDEERQ1  [LMG1025QDEERQ1]
U502  LMG1025QDEERQ1  [LMG1025QDEERQ1]

### Ports
FPGA_START_TRIG (see Inputs_Outputs[3C]), GaN_Delay_IN+ (see Time_Delay[4B]), Laser_Cathode_Pin (see Laser_System[1C]), Laser_Delay_Cathode_Pin (see Laser_System[1B])

### Nets
5VGaN: C501.3(OUTPUT) C502.3(OUTPUT) C503.2 C504.2 U501.3(VDD) U502.3(VDD)
GND: C501.1(INPUT) C501.A2(GND_1) C501.B2(GND_2) C502.1(INPUT) C502.A2(GND_1) C502.B2(GND_2) C503.1 C504.1 Q501.2(S_1) Q501.4(S_2) Q502.2(S_1) Q502.4(S_2) U501.2(GND) U501.6(IN-) U501.7(EP/GND) U502.2(GND) U502.6(IN-) U502.7(EP/GND)
NetD701_3: R503.2 ; port Laser_Delay_Cathode_Pin
NetD703_3: R507.2 ; port Laser_Cathode_Pin
NetJ105_1: R506.2 ; port FPGA_START_TRIG
NetQ501_1: Q501.1(G) R501.2 R504.2
NetQ501_3: Q501.3(D) R503.1
NetQ502_1: Q502.1(G) R505.2 R508.2
NetQ502_3: Q502.3(D) R507.1
NetR501_1: R501.1 U501.4(OUTH)
NetR502_1: R502.1 U501.1(IN+)
NetR502_2: R502.2 ; port GaN_Delay_IN+
NetR504_1: R504.1 U501.5(OUTL)
NetR505_1: R505.1 U502.4(OUTH)
NetR506_1: R506.1 U502.1(IN+)
NetR508_1: R508.1 U502.5(OUTL)

### Notes on the sheet
- (near C502) @{"Id":"RYLOSSUY\OHMFIFNH","ObjectType":2} Turi but arciausiai VDD ir tada uz jo @{"Id":"RYLOSSUY\IISOTOIY","ObjectType":2}, abu ant tos pacios puses, induktyvumo sumazinimui.
  @{"Id":"RYLOSSUY\TTDRHOKD","ObjectType":2} Slopina visokius nepageidaujemus signalus
- Title:
- Date:
- Author:
- Sheet:
- Of
- File:

### Library data of the parts
C501 C502 = 100n 0603 FT: NFM18PC104R1C3D
C503 C504 = 1uF 0603: CGA3E1X7R1E105K080AC
R501 R505 = 2R2 0402: CRT0402-FZ-2R00GLF
R502 R506 = 22R 0402: ERA-2AKD220X
R503 R507 = 47R 0402: CRCW040247R0FKED
R504 R508 = 1R 0402: CRT0402-FZ-1R00GLF
U501 U502 = LMG1025QDEERQ1: GaN Driver

## Sheet Light_Detection.SchDoc
size A4; Date: *******; ApprovedBy: *******; CheckedBy: None; Author: *******; CompanyName: *******; DrawnBy: Name; Engineer: *******; Organization: *******; Address1: *******; Address2: *******; Address3: *******; Address4: *******; DocumentNumber: Doc Num; Revision: *******; SheetNumber: 7; SheetTotal: 8; CurrentTime: *******; CurrentDate: *******; Time: *******; DocumentFullPathAndName: *******; DocumentName: *******; ModifiedDate: *******; ImagePath: *******; ProjectName: *******; Application_BuildNumber: *******
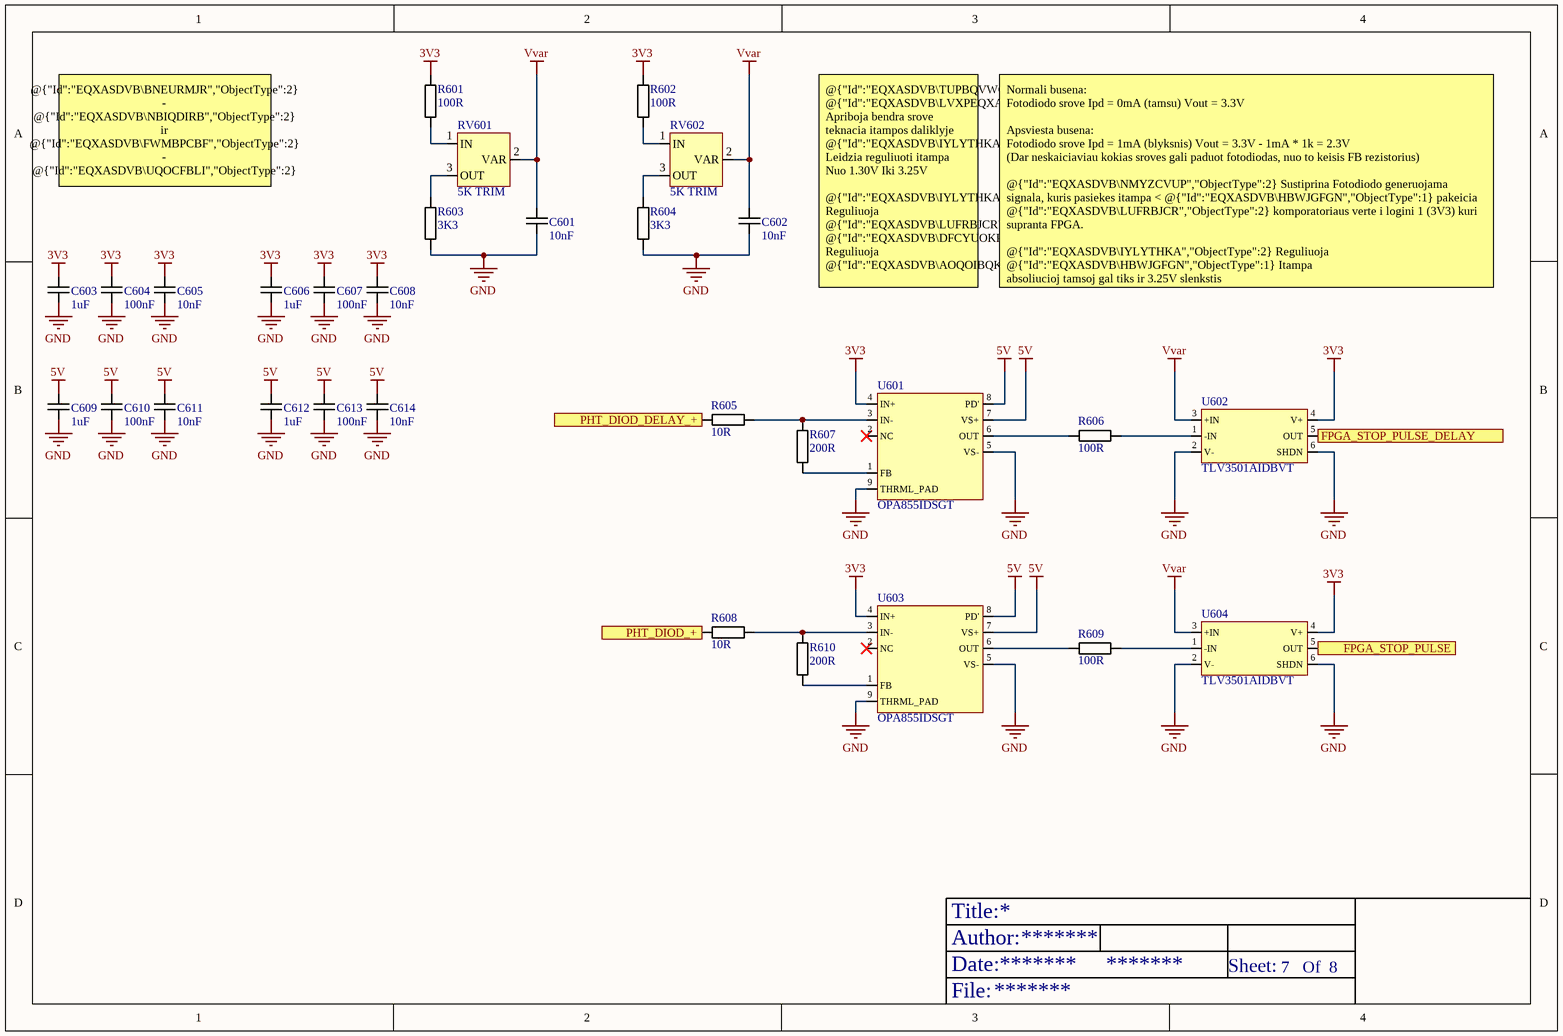
[diagram p6: Light_Detection.SchDoc]

### Parts
C601  10nF  [10nF 0402]
C602  10nF  [10nF 0402]
C603  1uF  [1uF 0603]
C604  100nF  [100nF 0402]
C605  10nF  [10nF 0402]
C606  1uF  [1uF 0603]
C607  100nF  [100nF 0402]
C608  10nF  [10nF 0402]
C609  1uF  [1uF 0603]
C610  100nF  [100nF 0402]
C611  10nF  [10nF 0402]
C612  1uF  [1uF 0603]
C613  100nF  [100nF 0402]
C614  10nF  [10nF 0402]
R601  100R  [100R 0402]
R602  100R  [100R 0402]
R603  3K3  [3k3 0402]
R604  3K3  [3k3 0402]
R605  10R  [10R 0402]
R606  100R  [100R 0402]
R607  200R  [200R 0402]
R608  10R  [10R 0402]
R609  100R  [100R 0402]
R610  200R  [200R 0402]
RV601  5K TRIM  [5K TRIM]
RV602  5K TRIM  [5K TRIM]
U601  OPA855IDSGT  [OPA855IDSGT]
U602  TLV3501AIDBVT  [TLV3501AIDBVT]
U603  OPA855IDSGT  [OPA855IDSGT]
U604  TLV3501AIDBVT  [TLV3501AIDBVT]

### Ports
FPGA_STOP_PULSE (see Inputs_Outputs[4C]), FPGA_STOP_PULSE_DELAY (see Inputs_Outputs[4B]), PHT_DIOD_+ (see Laser_System[3C]), PHT_DIOD_DELAY_+ (see Laser_System[3B])

### Nets
3V3: C603.2 C604.2 C605.2 C606.2 C607.2 C608.2 R601.1 R602.1 U601.4(IN+) U602.4(V+) U603.4(IN+) U604.4(V+)
5V: C609.2 C610.2 C611.2 C612.2 C613.2 C614.2 U601.7(VS+) U601.8(PD') U603.7(VS+) U603.8(PD')
GND: C601.1 C602.1 C603.1 C604.1 C605.1 C606.1 C607.1 C608.1 C609.1 C610.1 C611.1 C612.1 C613.1 C614.1 R603.2 R604.2 U601.5(VS-) U601.9(THRML_PAD) U602.2(V-) U602.6(SHDN) U603.5(VS-) U603.9(THRML_PAD) U604.2(V-) U604.6(SHDN)
Vvar: C601.2 C602.2 RV601.2(VAR) RV602.2(VAR) U602.3(+IN) U604.3(+IN)
NetD702_1: R605.1 ; port PHT_DIOD_DELAY_+
NetD704_1: R608.1 ; port PHT_DIOD_+
NetJ104_1: U602.5(OUT) ; port FPGA_STOP_PULSE_DELAY
NetJ106_1: U604.5(OUT) ; port FPGA_STOP_PULSE
NetR601_2: R601.2 RV601.1(IN)
NetR602_2: R602.2 RV602.1(IN)
NetR603_1: R603.1 RV601.3(OUT)
NetR604_1: R604.1 RV602.3(OUT)
NetR605_2: R605.2 R607.2 U601.3(IN-)
NetR606_1: R606.1 U601.6(OUT)
NetR606_2: R606.2 U602.1(-IN)
NetR607_1: R607.1 U601.1(FB)
NetR608_2: R608.2 R610.2 U603.3(IN-)
NetR609_1: R609.1 U603.6(OUT)
NetR609_2: R609.2 U604.1(-IN)
NetR610_1: R610.1 U603.1(FB)

Not connected (* = marked no-connect by the designer): U601 2(NC)*; U603 2(NC)*

### Notes on the sheet
- @{"Id":"EQXASDVB\BNEURMJR","ObjectType":2} - @{"Id":"EQXASDVB\NBIQDIRB","ObjectType":2} ir @{"Id":"EQXASDVB\FWMBPCBF","ObjectType":2} - @{"Id":"EQXASDVB\UQOCFBLI","ObjectType":2}
  Reikalingi filtravimui, bei stabilios itampos islaikymui.
  Kiekviena eile kondensatoriu lituojasi kuo arciau mikruskes
  @{"Id":"EQXASDVB\NMYZCVUP","ObjectType":2} - @{"Id":"EQXASDVB\AOQOIBQK","ObjectType":2}
- @{"Id":"EQXASDVB\TUPBQVWC","ObjectType":2} @{"Id":"EQXASDVB\LVXPEQXA","ObjectType":2} Apriboja bendra srove teknacia itampos daliklyje
  @{"Id":"EQXASDVB\IYLYTHKA","ObjectType":2} Leidzia reguliuoti itampa
  Nuo 1.30V Iki 3.25V
  @{"Id":"EQXASDVB\IYLYTHKA","ObjectType":2} Reguliuoja @{"Id":"EQXASDVB\LUFRBJCR","ObjectType":2}
  @{"Id":"EQXASDVB\DFCYUOKP","ObjectType":2} Reguliuoja @{"Id":"EQXASDVB\AOQOIBQK","ObjectType":2}
- Normali busena:
  Fotodiodo srove Ipd = 0mA (tamsu) Vout = 3.3V
  Apsviesta busena:
  Fotodiodo srove Ipd = 1mA (blyksnis) Vout = 3.3V - 1mA * 1k = 2.3V
  (Dar neskaiciaviau kokias sroves gali paduot fotodiodas, nuo to keisis FB rezistorius)
  @{"Id":"EQXASDVB\NMYZCVUP","ObjectType":2} Sustiprina Fotodiodo generuojama signala, kuris pasiekes itampa < @{"Id":"EQXASDVB\HBWJGFGN","ObjectType":1} pakeicia @{"Id":"EQXASDVB\LUFRBJCR","ObjectType":2} komporatoriaus verte i logini 1 (3V3) kuri supranta FPGA.
  @{"Id":"EQXASDVB\IYLYTHKA","ObjectType":2} Reguliuoja @{"Id":"EQXASDVB\HBWJGFGN","ObjectType":1} Itampa
  absoliucioj tamsoj gal tiks ir 3.25V slenkstis
  Apsviestam kambari gali but reikes ir 1.30V slenkscio
- Title:
- Date:
- Author:
- Sheet:
- Of
- File:

### Library data of the parts
C601 C602 C605 C608 C611 C614 = 10nF 0402: C0402C103J5RACTU
C603 C606 C609 C612 = 1uF 0603: CGA3E1X7R1E105K080AC
C604 C607 C610 C613 = 100n 0402: C1005X7R1E104K050BB
R601 R602 R606 R609 = 100R 0402: ERA-2VEB1000X
R603 R604 = 3K3 0402: ERJ-U02F3301X
R605 R608 = 10R 0402: CRT0402-DZ-10R0GLF
R607 R610 = 200R 0402: ERA-2AED201X
RV601 RV602 = 5K TRIM: 3314G-1-502E
U601 U603 = OPA855IDSGT: OP ampas
U602 U604 = TLV3501AIDBVT: Comparatorius

## Sheet Laser_System.SchDoc
size A4; Date: *******; ApprovedBy: *******; CheckedBy: None; Author: *******; CompanyName: *******; DrawnBy: Name; Engineer: *******; Organization: *******; Address1: *******; Address2: *******; Address3: *******; Address4: *******; DocumentNumber: Doc Num; Revision: *******; SheetNumber: 8; SheetTotal: 8; CurrentTime: *******; CurrentDate: *******; Time: *******; DocumentFullPathAndName: *******; DocumentName: *******; ModifiedDate: *******; ImagePath: *******; ProjectName: *******; Application_BuildNumber: *******
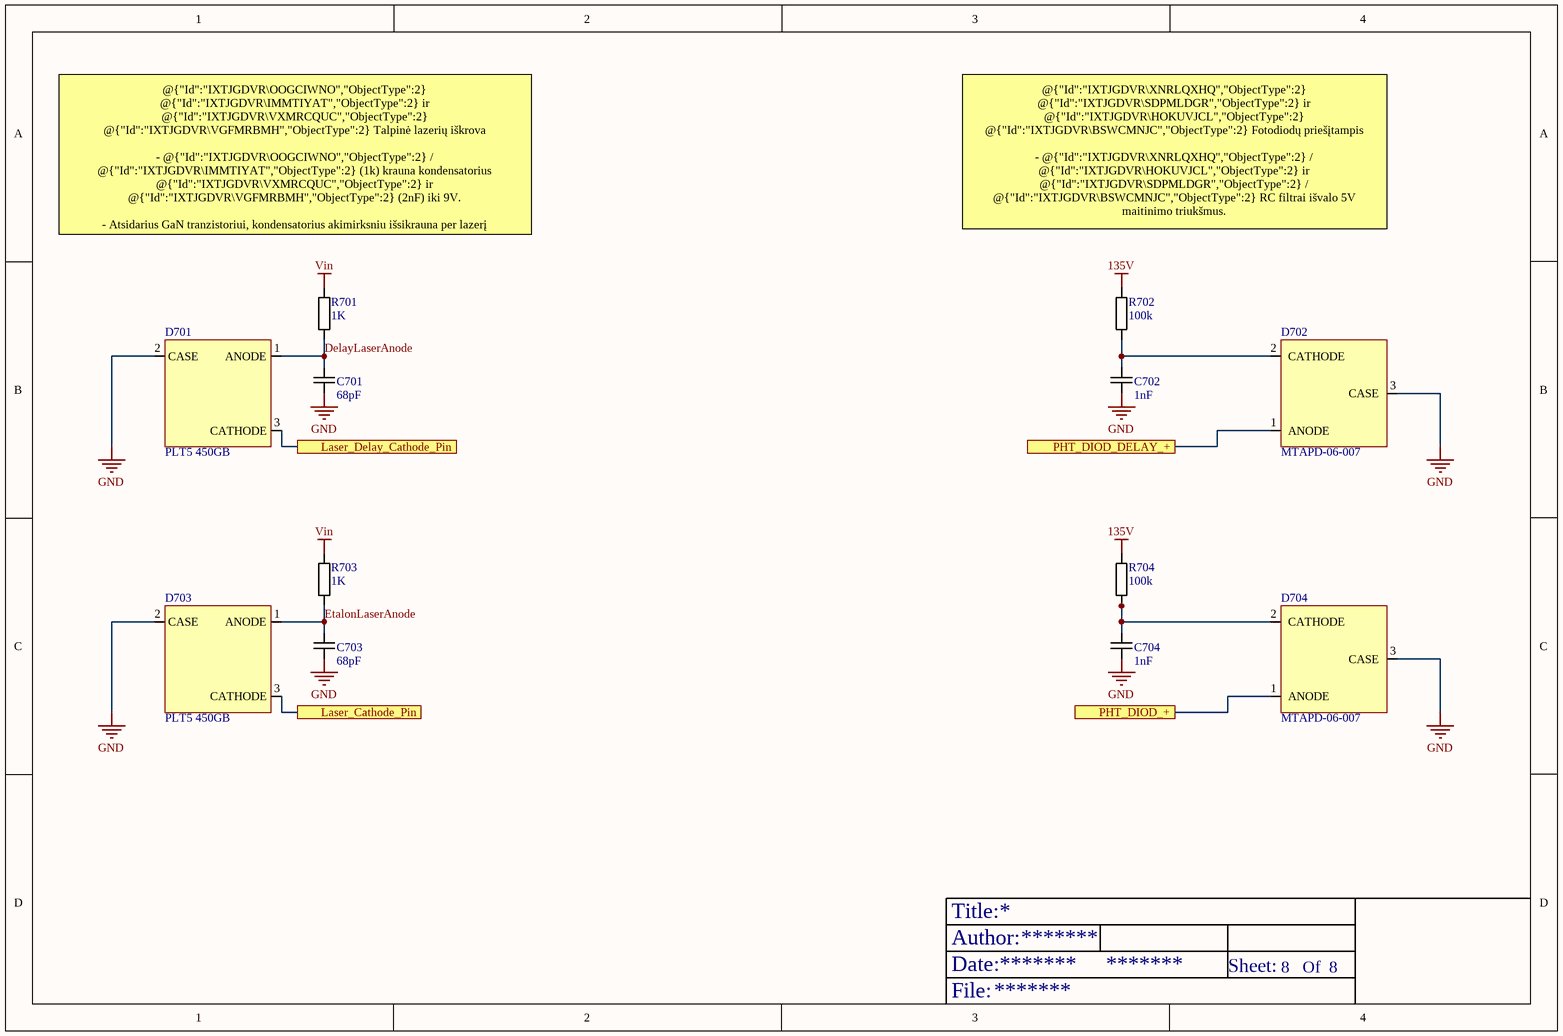
[diagram p7: Laser_System.SchDoc]

### Parts
C701  68pF  [2.2nF 0603]
C702  1nF  [10uF 0805]
C703  68pF  [2.2nF 0603]
C704  1nF  [10uF 0805]
D701  PLT5 450GB  [PLT5 450GB]
D702  MTAPD-06-007  [MTAPD-06-007]
D703  PLT5 450GB  [PLT5 450GB]
D704  MTAPD-06-007  [MTAPD-06-007]
R701  1K  [1k 0603]
R702  100k  [1k 0603]
R703  1K  [1k 0603]
R704  100k  [1k 0603]

### Ports
Laser_Cathode_Pin (see Laser_Driver[3C]), Laser_Delay_Cathode_Pin (see Laser_Driver[3B]), PHT_DIOD_+ (see Light_Detection[2C]), PHT_DIOD_DELAY_+ (see Light_Detection[2B])

### Nets
135V: R702.2 R704.2
GND: C701.1 C702.1 C703.1 C704.1 D701.2(CASE) D702.3(CASE) D703.2(CASE) D704.3(CASE)
Vin: R701.2 R703.2
DelayLaserAnode: C701.2 D701.1(ANODE) R701.1
EtalonLaserAnode: C703.2 D703.1(ANODE) R703.1
NetC702_2: C702.2 D702.2(CATHODE) R702.1
NetC704_2: C704.2 D704.2(CATHODE) R704.1
NetD701_3: D701.3(CATHODE) ; port Laser_Delay_Cathode_Pin
NetD702_1: D702.1(ANODE) ; port PHT_DIOD_DELAY_+
NetD703_3: D703.3(CATHODE) ; port Laser_Cathode_Pin
NetD704_1: D704.1(ANODE) ; port PHT_DIOD_+

### Notes on the sheet
- @{"Id":"IXTJGDVR\OOGCIWNO","ObjectType":2} @{"Id":"IXTJGDVR\IMMTIYAT","ObjectType":2} ir @{"Id":"IXTJGDVR\VXMRCQUC","ObjectType":2} @{"Id":"IXTJGDVR\VGFMRBMH","ObjectType":2} Talpinė lazerių iškrova
  - @{"Id":"IXTJGDVR\OOGCIWNO","ObjectType":2} / @{"Id":"IXTJGDVR\IMMTIYAT","ObjectType":2} (1k) krauna kondensatorius @{"Id":"IXTJGDVR\VXMRCQUC","ObjectType":2} ir @{"Id":"IXTJGDVR\VGFMRBMH","ObjectType":2} (2nF) iki 9V.
  - Atsidarius GaN tranzistoriui, kondensatorius akimirksniu išsikrauna per lazerį
  ( @{"Id":"IXTJGDVR\VURCQILD","ObjectType":2} / @{"Id":"IXTJGDVR\NUGRJXVH","ObjectType":2} ) į žemę ir duoda aštrų sub-ns šviesos impulsą.
  - Kondensatoriui išsikrovus lazeris užgęsta pats, o 1k varža apsaugo jį nuo sudegimo.
- @{"Id":"IXTJGDVR\XNRLQXHQ","ObjectType":2} @{"Id":"IXTJGDVR\SDPMLDGR","ObjectType":2} ir @{"Id":"IXTJGDVR\HOKUVJCL","ObjectType":2} @{"Id":"IXTJGDVR\BSWCMNJC","ObjectType":2} Fotodiodų priešįtampis
  - @{"Id":"IXTJGDVR\XNRLQXHQ","ObjectType":2} / @{"Id":"IXTJGDVR\HOKUVJCL","ObjectType":2} ir @{"Id":"IXTJGDVR\SDPMLDGR","ObjectType":2} / @{"Id":"IXTJGDVR\BSWCMNJC","ObjectType":2} RC filtrai išvalo 5V maitinimo triukšmus.
  - Katodai pajungti prie 5V, o Anodai per OPA855 (@{"Id":"EQXASDVB\NMYZCVUP","ObjectType":2} ir @{"Id":"EQXASDVB\IJIHGKBT","ObjectType":2}) sėdi ties 3.3V
  (1.7V atbulinis priešįtampis maksimaliai sumažina diodo talpą ir padidina greitį).
  - Šviesos blyksnio srovė siunčiama tiesiai į OPA855 stiprintuvą.
- Title:
- Date:
- Author:
- Sheet:
- Of
- File:

### Library data of the parts
C701 = 2.2nF 0603: C0603X222K1REC7411
C702 C704 = 1nF 0805: GCM21AR72E102KWB1J
C703 = 2.2nF 0603: C0402C680K5RACAUTO
D701 D703 = PLT5 450GB: Lazeris
R701 R703 = 1K 0603: ERA-3AEB102V
R702 R704 = 100k 0603: CR0603-FX-1003ELF

## Nets that join several sheets
3V3: Rx_PSU (10 pins), Tx_PSU (5 pins), Time_Delay (12 pins), Light_Detection (12 pins)
5V: Rx_PSU (10 pins), Light_Detection (10 pins)
5VGaN: Tx_PSU (10 pins), Laser_Driver (6 pins)
135V: Inputs_Outputs (J109.1 J110.1 J113.1 J114.1), Rx_PSU (C218.2 D201.1 R209.2), Laser_System (R702.2 R704.2)
GND: Inputs_Outputs (20 pins), Rx_PSU (42 pins), Tx_PSU (24 pins), Time_Delay (15 pins), Laser_Driver (18 pins), Light_Detection (24 pins), Laser_System (8 pins)
Vin: Inputs_Outputs (10 pins), Rx_PSU (20 pins), Tx_PSU (12 pins), Laser_System (R701.2 R703.2)
NetD701_3: Laser_Driver (R503.2), Laser_System (D701.3)
NetD702_1: Light_Detection (R605.1), Laser_System (D702.1)
NetD703_3: Laser_Driver (R507.2), Laser_System (D703.3)
NetD704_1: Light_Detection (R608.1), Laser_System (D704.1)
NetJ101_2: Inputs_Outputs (J101.2), Time_Delay (U403.23)
NetJ101_3: Inputs_Outputs (J101.3), Time_Delay (U403.25)
NetJ101_4: Inputs_Outputs (J101.4), Time_Delay (U403.26)
NetJ101_5: Inputs_Outputs (J101.5), Time_Delay (U403.27)
NetJ101_6: Inputs_Outputs (J101.6), Time_Delay (U403.29)
NetJ101_7: Inputs_Outputs (J101.7), Time_Delay (U403.30)
NetJ101_8: Inputs_Outputs (J101.8), Time_Delay (U403.31)
NetJ101_9: Inputs_Outputs (J101.9), Time_Delay (U403.32)
NetJ101_10: Inputs_Outputs (J101.10), Time_Delay (U403.1)
NetJ101_11: Inputs_Outputs (J101.11), Time_Delay (U403.2)
NetJ102_1: Inputs_Outputs (J102.1), Time_Delay (U401.7)
NetJ104_1: Inputs_Outputs (J104.1), Light_Detection (U602.5)
NetJ105_1: Inputs_Outputs (J105.1), Laser_Driver (R506.2)
NetJ106_1: Inputs_Outputs (J106.1), Light_Detection (U604.5)
NetR502_2: Time_Delay (U402.7), Laser_Driver (R502.2)